# EAGLE design Boules_de_Noël (EAGLE 8.4.3)
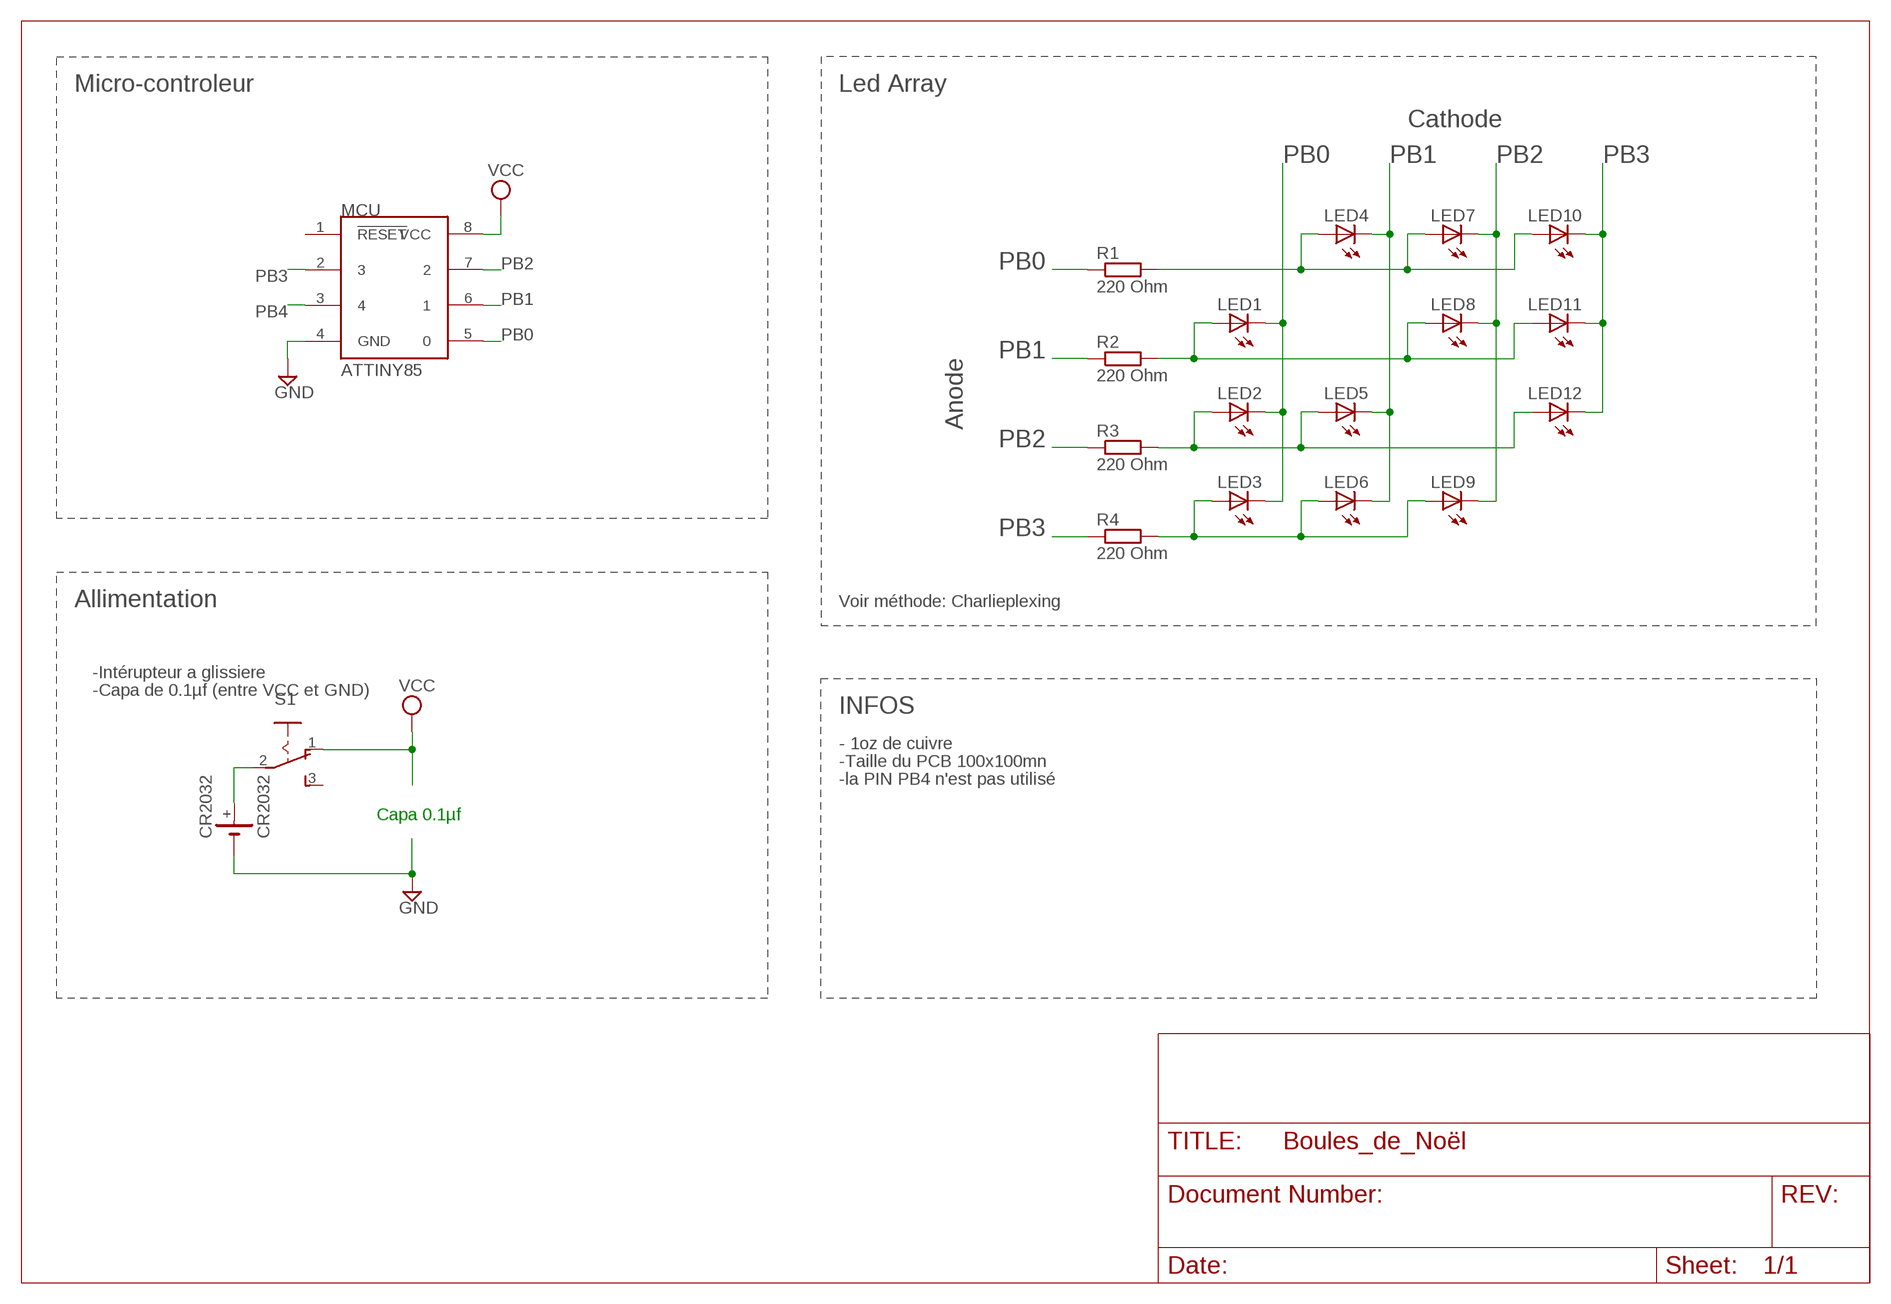
[diagram p0: schematic, sheet 1]

## Parts
CR2032  CR2032  [FRONTCR2032]
LED1  LEDCHIP-LED0805  [CHIP-LED0805]
LED2  LEDCHIP-LED0805  [CHIP-LED0805]
LED3  LEDCHIP-LED0805  [CHIP-LED0805]
LED4  LEDCHIP-LED0805  [CHIP-LED0805]
LED5  LEDCHIP-LED0805  [CHIP-LED0805]
LED6  LEDCHIP-LED0805  [CHIP-LED0805]
LED7  LEDCHIP-LED0805  [CHIP-LED0805]
LED8  LEDCHIP-LED0805  [CHIP-LED0805]
LED9  LEDCHIP-LED0805  [CHIP-LED0805]
LED10  LEDCHIP-LED0805  [CHIP-LED0805]
LED11  LEDCHIP-LED0805  [CHIP-LED0805]
LED12  LEDCHIP-LED0805  [CHIP-LED0805]
MCU  ATTINY85  [8P3]
R1  220 Ohm  R-EU_M0805  [M0805]
R2  220 Ohm  R-EU_M0805  [M0805]
R3  220 Ohm  R-EU_M0805  [M0805]
R4  220 Ohm  R-EU_M0805  [M0805]
S1  255SB  [255SB]

## Nets
GND: CR2032.- MCU.4(GND)
N$1: CR2032.+ S1.2(P)
PB0: LED1.C LED2.C LED3.C MCU.5 R1.1
PB1: LED4.C LED5.C LED6.C MCU.6 R2.1
PB2: LED7.C LED8.C LED9.C MCU.7 R3.1
PB3: LED10.C LED11.C LED12.C MCU.2 R4.1
PB4: MCU.3
R1: LED4.A LED7.A LED10.A R1.2
R2: LED1.A LED8.A LED11.A R2.2
R3: LED2.A LED5.A LED12.A R3.2
R4: LED3.A LED6.A LED9.A R4.2
VCC: MCU.8(VCC) S1.1(O)
Unconnected: MCU.1(!RESET) S1.3(S)

## Notes on the sheet
- Micro-controleur | Led Array
- Cathode
- Anode
- Allimentation | Voir méthode: Charlieplexing
- -Intérupteur a glissiere
- -Capa de 0.1µf (entre VCC et GND)
- INFOS
- - 1oz de cuivre
- -Taille du PCB 100x100mn
- -la PIN PB4 n'est pas utilisé
- Capa 0.1µf

## Library data of the parts
CR2032 = Batterie:CR2032
LED1-LED12 = adafruit:LED: LED OSRAM: - CHIPLED LG R971, LG N971, LY N971, LG Q971, LY Q971, LO R971, LY R971 LH N974, LH R974 LS Q976, LO Q976, LY Q976 LO Q996 - Hyper CHIPLED LW Q18S LB Q993, LB Q99A, LB R99A - SideLED LS A670, LO A670, LY A670, LG A670, LP A670 LB A673, LV A673, LT A673, LW A673 LH A674 LY A675 LS A676, LA A676, LO A676, LY A676, LW A676 LS A679, LY A679, LG A679 - Hyper Micro SIDELED® LS Y876, LA Y876, LO Y876, LY Y876 LT Y87S - SmartLED LW L88C, LW L88S LB L89C, LB L89S, LG L890 LS L89K, LO L89K, LY L89K LS L896, LA L896, LO L896, LY L896 - TOPLED LS T670, LO T670, LY T670, LG T670, LP T670 LSG T670, LSP T670, LSY T670, LOP T670, LYG T670 LG T671, LOG T671, LSG T671 LB T673, LV T673, LT T673, LW T673 LH T674 LS T676, LA T676, LO T676, LY T676, LB T676, LH T676, LSB T676, LW T676 LB T67C, LV T67C, LT T67C, LS T67K, LO T67K, LY T67K, LW E67C LS E67B, LA E67B, LO E67B, LY E67B, LB E67C, LV E67C, LT E67C LW T67C LS T679, LY T679, LG T679 LS T770, LO T770, LY T770, LG T770, LP T770 LB T773, LV T773, LT T773, LW T773 LH T774 LS E675, LA E675, LY E675, LS T675 LS T776, LA T776, LO T776, LY T776, LB T776 LHGB T686 LT T68C, LB T68C - Hyper Mini TOPLED® LB M676 - Mini TOPLED Santana® LG M470 LS M47K, LO M47K, LY M47K Source: http://www.osram.convergy.de/
MCU = attiny85:ATTINY85
R1-R4 = resistor:R-EU_: RESISTOR, European symbol
S1 = switch:255SB: SLIDING SWITCH Distributor Buerklin, 11G810

## Board
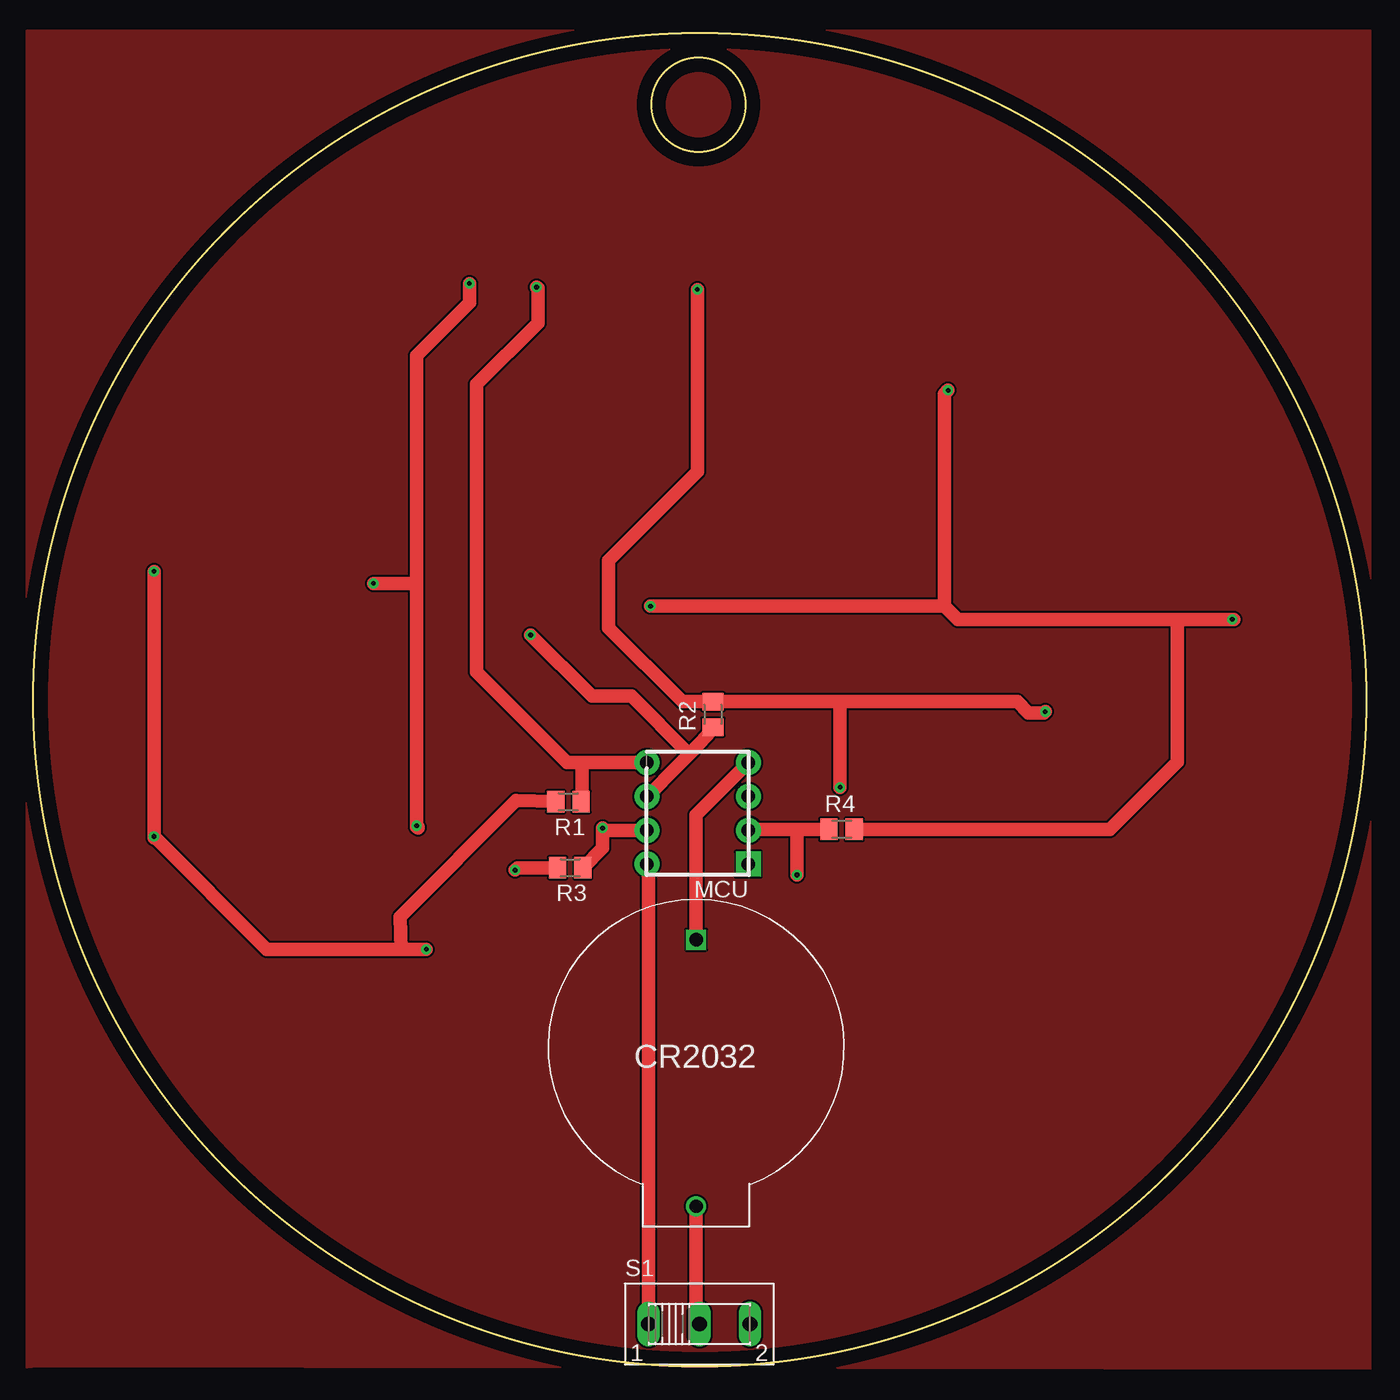
[diagram p1: board, top side]
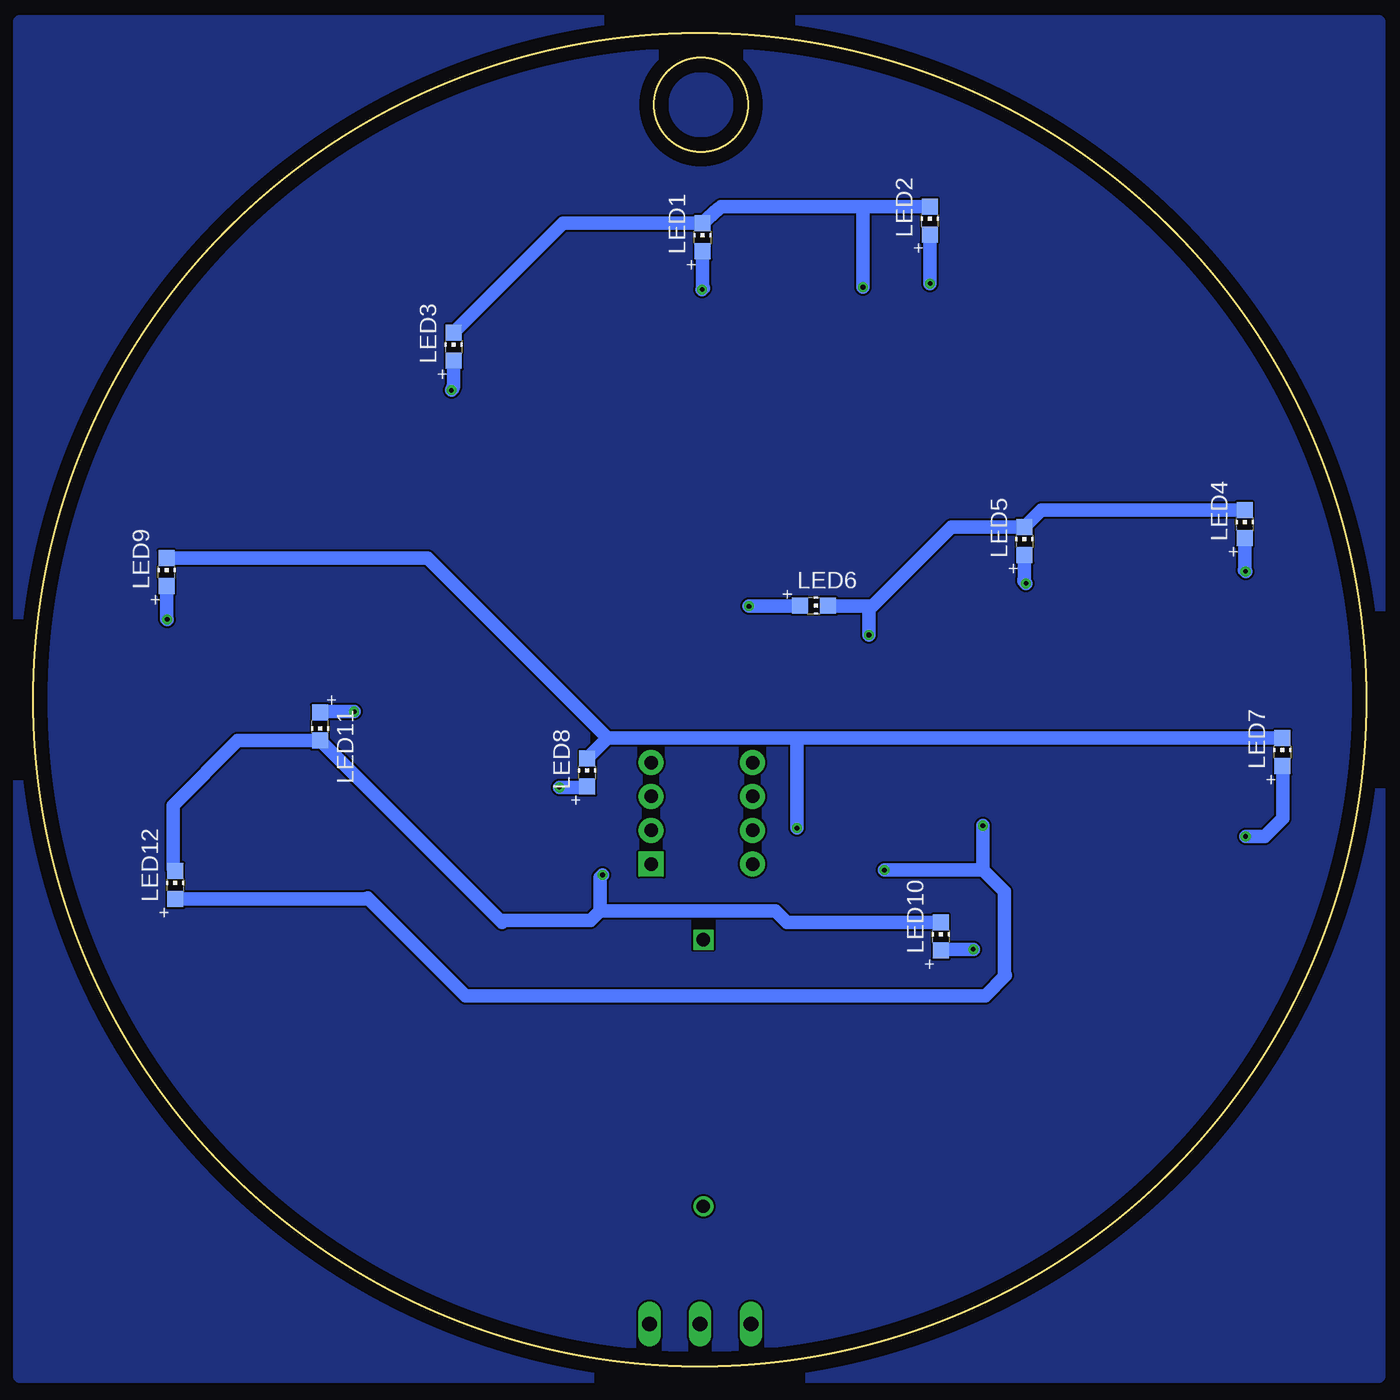
[diagram p2: board, bottom side, seen from below]

Size 100 x 100 mm. Coordinates in mm from the lower left corner, seen from the top.
Outline: circle at 50,50 radius 50
Outline: circle at 49.91,94.64 radius 3.51
Copper layers (1*16): Top 0.035mm / dielectric 1.5mm / Bottom 0.035mm
Design rules "default": minimum track width 6mil, minimum drill 0.35mm, track to track 6mil, track to pad 6mil, pad to pad 6mil, via to via 6mil, smd to smd 6mil, copper to edge 40mil, drill to drill 6mil, minimum pad ring 10mil, minimum via ring 8mil, stop-mask expansion 4mil, vias tented up to drill 0mil, thermal gap 10mil

### Footprints (pad centres in the part's own frame; a part is rotated, then mirrored left to right if it is on the bottom)
FRONTCR2032 = drill 1: + 0,12 | drill 1 square: - 0,-8
CHIP-LED0805 = smd 1.2 x 1.2: A 0,-1.05; C 0,1.05
8P3 = drill 1.016 pad 1.88 square: 1 -3.81,3.81 | drill 1.016 pad 1.88: 2 -3.81,1.27; 3 -3.81,-1.27; 4 -3.81,-3.81; 5 3.81,-3.81; 6 3.81,-1.27; 7 3.81,1.27; 8 3.81,3.81
M0805 = smd 1.3 x 1.6: 1 -0.95,0; 2 0.95,0
255SB = drill 1.118 long: 1 -3.81,0; 2 0,0; 3 3.81,0

### Placement (x,y rotation side)
CR2032  49.73,23.99 180 top
LED1  49.79,84.7 0 bottom
LED2  32.74,85.96 0 bottom
LED3  68.46,76.49 0 bottom
LED4  9.11,63.17 0 bottom
LED5  25.63,61.91 0 bottom
LED6  41.43,57.05 270 bottom
LED7  6.29,46.07 0 bottom
LED8  58.45,44.54 0 bottom
LED9  90,59.57 0 bottom
LED10  31.91,32.23 0 bottom
LED11  78.49,47.98 180 bottom
LED12  89.34,36.1 0 bottom
MCU  49.84,41.48 180 top
R1  40.14,42.35 180 top
R2  50.99,48.9 90 top
R3  40.28,37.4 180 top
R4  60.64,40.28 0 top
S1  49.97,3.16 0 top

### Tracks (layer width: path | path; a pad name or v marks a point on that pad's centre or on a via)
GND
  Top 1.016: MCU.4 49.73,41.37 CR2032.-
N$1
  Top 1.016: CR2032.+ 49.73,3.4 S1.2
PB0  (via drill 0.35)
  Top 1.016: MCU.5 41.18,45.29 | 41.18,45.29 40.04,45.29 33.26,52.07 33.26,73.67 37.85,78.26 37.85,80.87 v37.76,80.96 | 41.18,45.29 41.18,42.44 R1.1
  Bottom 1.016: LED3.C 60.25,85.75 LED1.C 48.58,86.83 48.4,87.01 37.76,87.01 | 37.76,87.01 LED2.C | v37.76,80.96 37.76,87.01
PB1  (via drill 0.35)
  Top 1.016: MCU.6 46.08,42.75 48.38,45.05 49.27,45.98 | 49.27,45.98 50.54,47.32 R2.1 | 49.27,45.98 49.16,45.98 44.87,50.27 41.9,50.27 v37.31,54.86
  Bottom 1.016: LED4.C 24.37,64.22 LED5.C 31.1,62.96 37.04,57.02 | 37.04,57.02 37.31,56.75 v37.31,54.86 | LED6.C 40.35,57.02 37.04,57.02
PB2  (via drill 0.35)
  Top 1.016: MCU.7 42.87,40.21 v42.71,40.37 42.71,38.88 R3.1
  Bottom 1.016: 42.44,47.12 LED7.C | 42.44,47.12 56.92,47.12 | 56.92,47.12 LED8.C | 86.09,60.62 85.73,60.62 | 86.09,60.62 LED9.C | v42.71,40.37 42.71,46.85 42.44,47.12 | 56.92,47.12 70.42,60.62 86.09,60.62
PB3  (via drill 0.35)
  Top 1.016: R4.1 57.29,40.28 | 57.29,40.28 53.72,40.28 MCU.2 | 57.29,40.28 v57.29,36.86
  Bottom 1.016: LED12.C 89.51,37.32 89.51,42.08 84.65,46.94 83.84,46.94 83.83,46.93 LED11.C 64.84,33.28 64.68,33.44 58.19,33.44 57.47,34.16 | 57.38,36.77 v57.29,36.86 57.47,36.68 57.47,34.16 | LED10.C 43.45,33.28 44.33,34.16 57.47,34.16
R1  (via drill 0.35)
  Top 1.016: v9.05,39.74 v9.05,59.63 | 9.05,39.65 v9.05,39.74 | v29.48,31.28 27.59,31.28 | 27.59,31.28 17.51,31.28 v9.05,39.74 | 27.59,31.28 27.5,33.71 36.23,42.44 R1.2
  Bottom 1.016: LED4.A 9.11,59.75 9.14,59.72 v9.05,59.63 | LED7.A 6.26,44.99 6.26,41.09 7.61,39.74 v9.05,39.74 | LED10.A 31.81,31.28 v29.48,31.28
R2  (via drill 0.35)
  Top 1.016: v49.82,80.78 49.82,67.1 43.16,60.44 43.16,55.4 48.71,49.85 R2.2 60.44,49.85 | v75.92,49.1 75.83,49.01 74.66,49.01 73.82,49.85 60.44,49.85 | v60.53,43.43 60.53,49.76 60.44,49.85
  Bottom 1.016: LED8.A 58.51,43.43 v60.53,43.43 | LED1.A 49.79,80.93 49.73,80.87 v49.82,80.78 | v75.92,49.1 78.42,49.1 LED11.A
R3  (via drill 0.35)
  Top 1.016: v25.52,58.73 28.76,58.73 | 28.76,58.73 v28.76,40.55 | v28.76,40.55 28.76,40.46 28.85,40.37 28.85,40.46 v28.76,40.55 | v36.14,37.22 36.32,37.4 R3.2 | 28.76,58.73 28.76,75.83 32.72,79.79 v32.72,81.23
  Bottom 1.016: LED5.A 25.63,59.07 25.7,59 25.7,58.91 v25.52,58.73 | LED12.A 75.03,35.05 74.93,35.15 67.55,27.77 28.58,27.77 27.05,29.3 27.14,29.39 27.14,35.6 28.76,37.22 28.85,37.22 | v28.76,40.55 28.76,37.31 28.85,37.22 | 28.85,37.22 v36.14,37.22 | v32.72,81.23 32.72,84.89 LED2.A
R4  (via drill 0.35)
  Top 1.016: 86.36,56.03 85.82,56.03 85.82,45.32 80.78,40.28 R4.2 | 86.36,56.03 v89.96,56.03 90.05,56.03 | v46.31,57.02 68.36,57.02 | v68.63,73.22 68.36,72.95 68.36,57.02 | 86.36,56.03 69.35,56.03 68.36,57.02
  Bottom 1.016: v89.96,56.03 90,56.07 LED9.A | LED3.A 68.46,73.48 68.54,73.4 68.54,73.31 v68.63,73.22 | LED6.A 42.51,57.02 v46.31,57.02
S$1
  pour Top: -0.49,-0.13 -0.49,100.22 100.31,100.22 100.31,-0.22 0.32,-0.04
S$2
  pour Bottom: -0.94,-0.76 101.03,-0.76 101.03,100.85 -0.94,100.85
VCC
  Top 1.016: S1.1 46.16,37.67 MCU.8